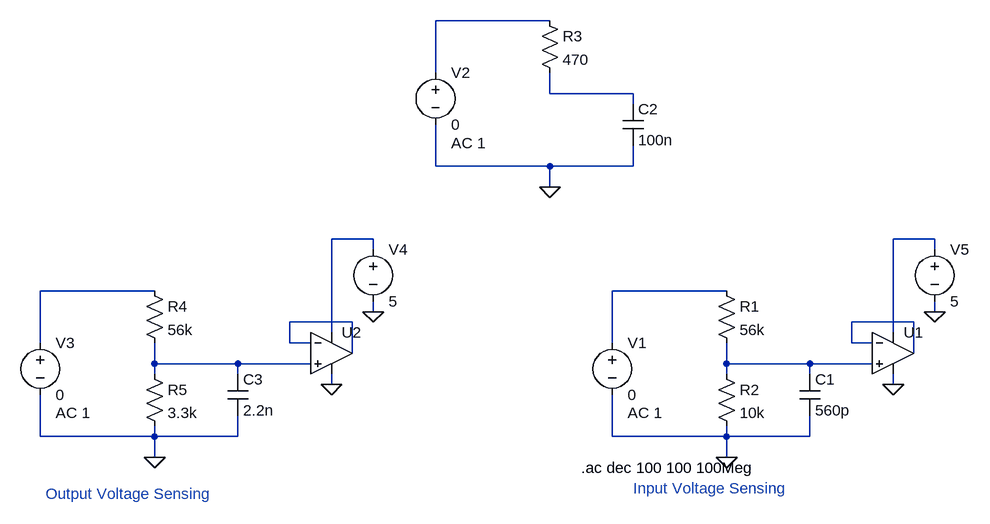
[diagram p0: schematic sensing.asc]
sensing.asc, the LTspice schematic file:
Version 4.1
SHEET 1 880 680
WIRE -192 -336 -368 -336
WIRE -368 -256 -368 -336
WIRE -192 -224 -192 -256
WIRE -64 -224 -192 -224
WIRE -64 -208 -64 -224
WIRE -368 -112 -368 -176
WIRE -192 -112 -368 -112
WIRE -64 -112 -64 -144
WIRE -64 -112 -192 -112
WIRE -192 -80 -192 -112
WIRE -464 0 -528 0
WIRE 400 0 336 0
WIRE -464 16 -464 0
WIRE 400 16 400 0
WIRE -800 80 -976 80
WIRE 80 80 -96 80
WIRE -464 112 -464 96
WIRE 400 112 400 96
WIRE -496 128 -592 128
WIRE 368 128 272 128
WIRE -528 144 -528 0
WIRE 336 144 336 0
WIRE -976 160 -976 80
WIRE -592 160 -592 128
WIRE -560 160 -592 160
WIRE -96 160 -96 80
WIRE 272 160 272 128
WIRE 304 160 272 160
WIRE -496 176 -496 128
WIRE 368 176 368 128
WIRE -800 192 -800 160
WIRE -672 192 -800 192
WIRE -560 192 -672 192
WIRE 80 192 80 160
WIRE 208 192 80 192
WIRE 304 192 208 192
WIRE -800 208 -800 192
WIRE -672 208 -672 192
WIRE 80 208 80 192
WIRE 208 208 208 192
WIRE -528 224 -528 208
WIRE 336 224 336 208
WIRE -976 304 -976 240
WIRE -800 304 -800 288
WIRE -800 304 -976 304
WIRE -672 304 -672 272
WIRE -672 304 -800 304
WIRE -96 304 -96 240
WIRE 80 304 80 288
WIRE 80 304 -96 304
WIRE 208 304 208 272
WIRE 208 304 80 304
WIRE -800 336 -800 304
WIRE 80 336 80 304
FLAG 80 336 0
FLAG -192 -80 0
FLAG -800 336 0
FLAG -464 112 0
FLAG -528 224 0
FLAG 400 112 0
FLAG 336 224 0
SYMBOL res 64 64 R0
SYMATTR InstName R1
SYMATTR Value 56k
SYMBOL res 64 192 R0
SYMATTR InstName R2
SYMATTR Value 10k
SYMBOL cap 192 208 R0
SYMATTR InstName C1
SYMATTR Value 560p
SYMBOL voltage -96 144 R0
WINDOW 123 24 124 Left 2
WINDOW 39 0 0 Left 0
SYMATTR InstName V1
SYMATTR Value 0
SYMATTR Value2 AC 1
SYMBOL res -208 -352 R0
SYMATTR InstName R3
SYMATTR Value 470
SYMBOL cap -80 -208 R0
SYMATTR InstName C2
SYMATTR Value 100n
SYMBOL voltage -368 -272 R0
WINDOW 123 24 124 Left 2
WINDOW 39 0 0 Left 0
SYMATTR InstName V2
SYMATTR Value 0
SYMATTR Value2 AC 1
SYMBOL res -816 64 R0
SYMATTR InstName R4
SYMATTR Value 56k
SYMBOL res -816 192 R0
SYMATTR InstName R5
SYMATTR Value 3.3k
SYMBOL cap -688 208 R0
SYMATTR InstName C3
SYMATTR Value 2.2n
SYMBOL voltage -976 144 R0
WINDOW 123 24 124 Left 2
WINDOW 39 0 0 Left 0
SYMATTR InstName V3
SYMATTR Value 0
SYMATTR Value2 AC 1
SYMBOL OpAmps\\UniversalOpAmp -528 176 R0
SYMATTR InstName U2
SYMBOL voltage -464 0 R0
WINDOW 123 0 0 Left 0
WINDOW 39 0 0 Left 0
SYMATTR InstName V4
SYMATTR Value 5
SYMBOL OpAmps\\UniversalOpAmp 336 176 R0
SYMATTR InstName U1
SYMBOL voltage 400 0 R0
WINDOW 123 0 0 Left 0
WINDOW 39 0 0 Left 0
SYMATTR InstName V5
SYMATTR Value 5
TEXT -144 352 Left 2 !.ac dec 100 100 100Meg
TEXT -64 384 Left 2 ;Input Voltage Sensing
TEXT -968 392 Left 2 ;Output Voltage Sensing

The netlist it stands for:
* sensing.asc
R1 N006 N010 56k
R2 N010 0 10k
C1 N010 0 560p
V1 N006 0 0 AC 1
R3 N001 N002 470
C2 N002 0 100n
V2 N001 0 0 AC 1
R4 N005 N009 56k
R5 N009 0 3.3k
C3 N009 0 2.2n
V3 N005 0 0 AC 1
X§U2 N009 N007 N003 0 N007 level1 Avol=1Meg GBW=10Meg Vos=0 En=0 Enk=0 In=0 Ink=0 Rin=500Meg  ; pins In+ In- V+ V- OUT
V4 N003 0 5
X§U1 N010 N008 N004 0 N008 level1 Avol=1Meg GBW=10Meg Vos=0 En=0 Enk=0 In=0 Ink=0 Rin=500Meg  ; pins In+ In- V+ V- OUT
V5 N004 0 5
.ac dec 100 100 100Meg
* Input Voltage Sensing
* Output Voltage Sensing
.lib UniversalOpAmp1.lib
.backanno
.end